# Altium schematic sheet StanzaBoard.SchDoc
size 594 x 420 mm
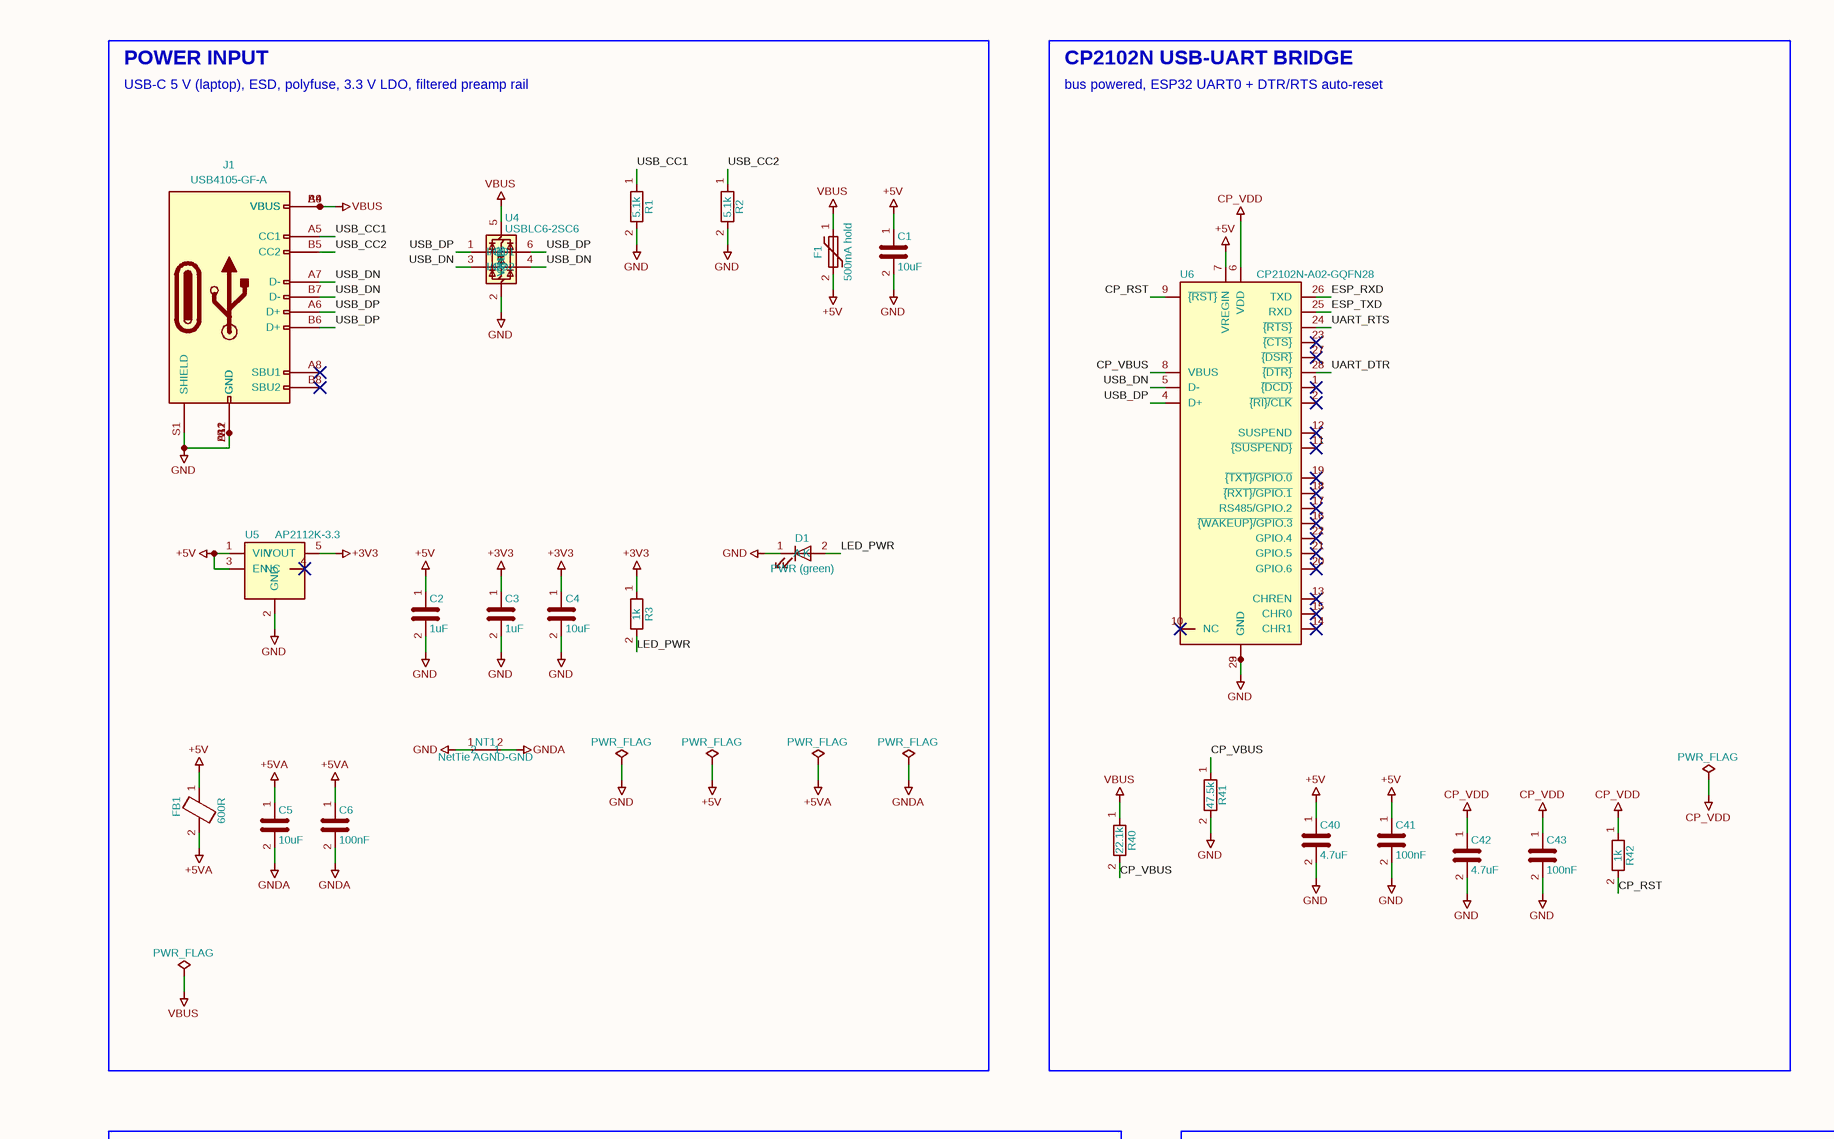
[diagram p0: StanzaBoard.SchDoc, top left]
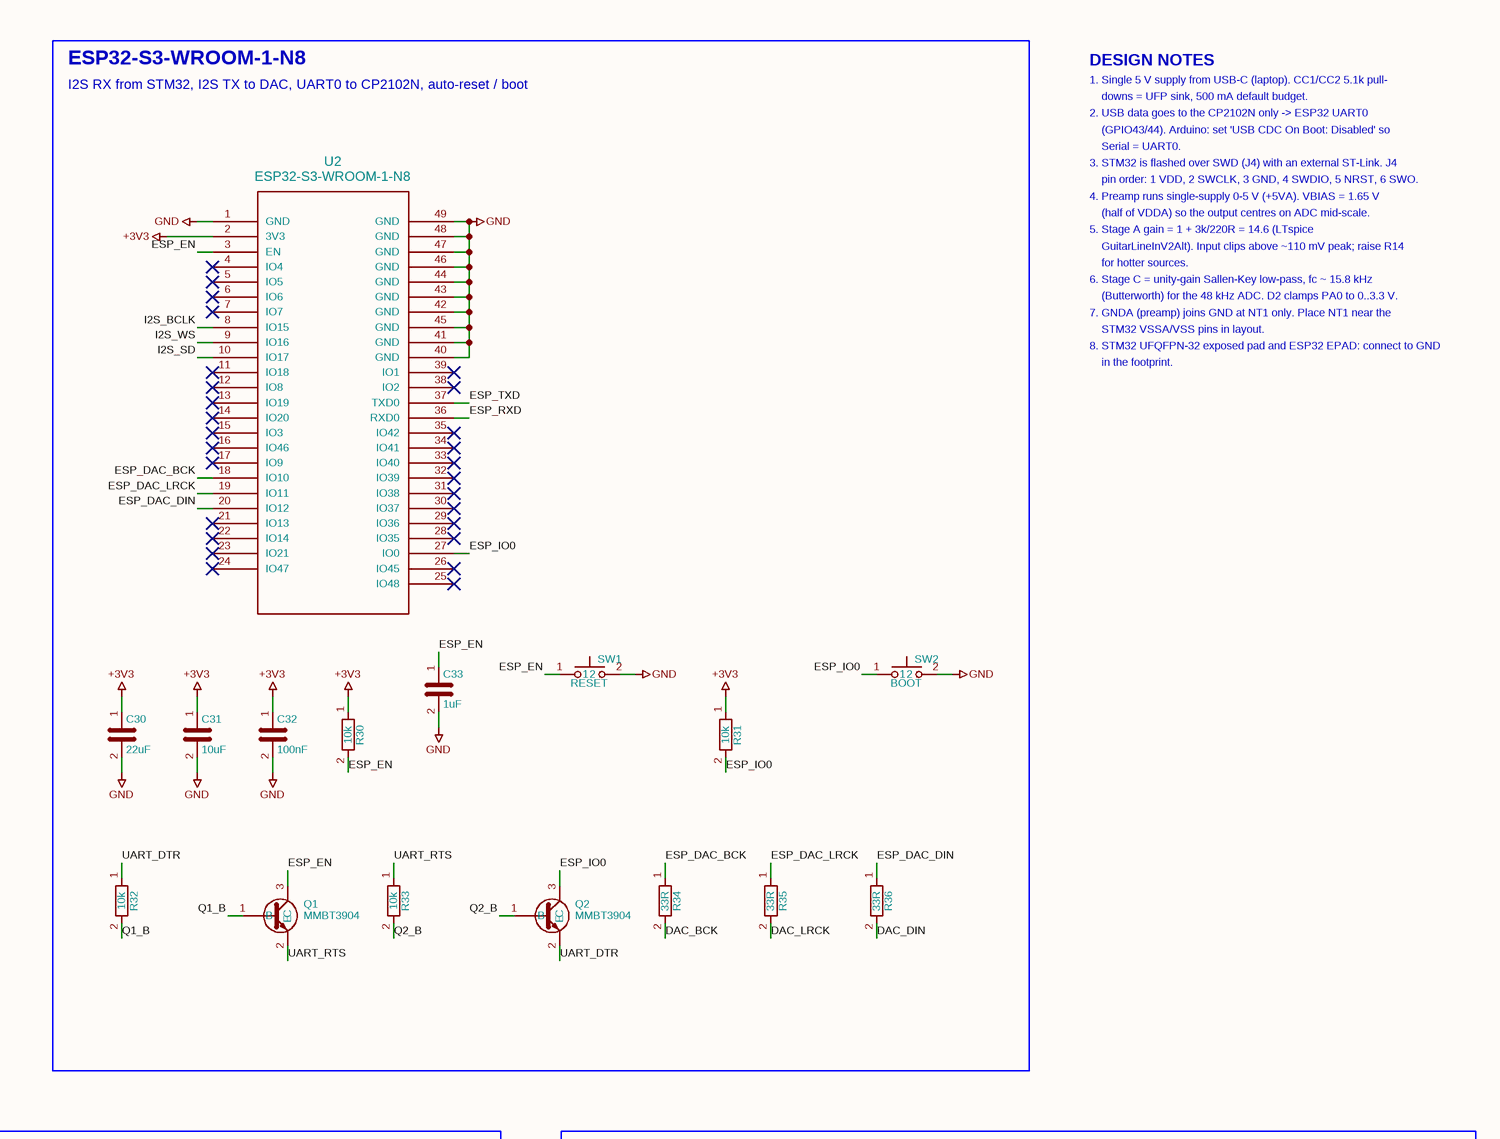
[diagram p1: StanzaBoard.SchDoc, top right]
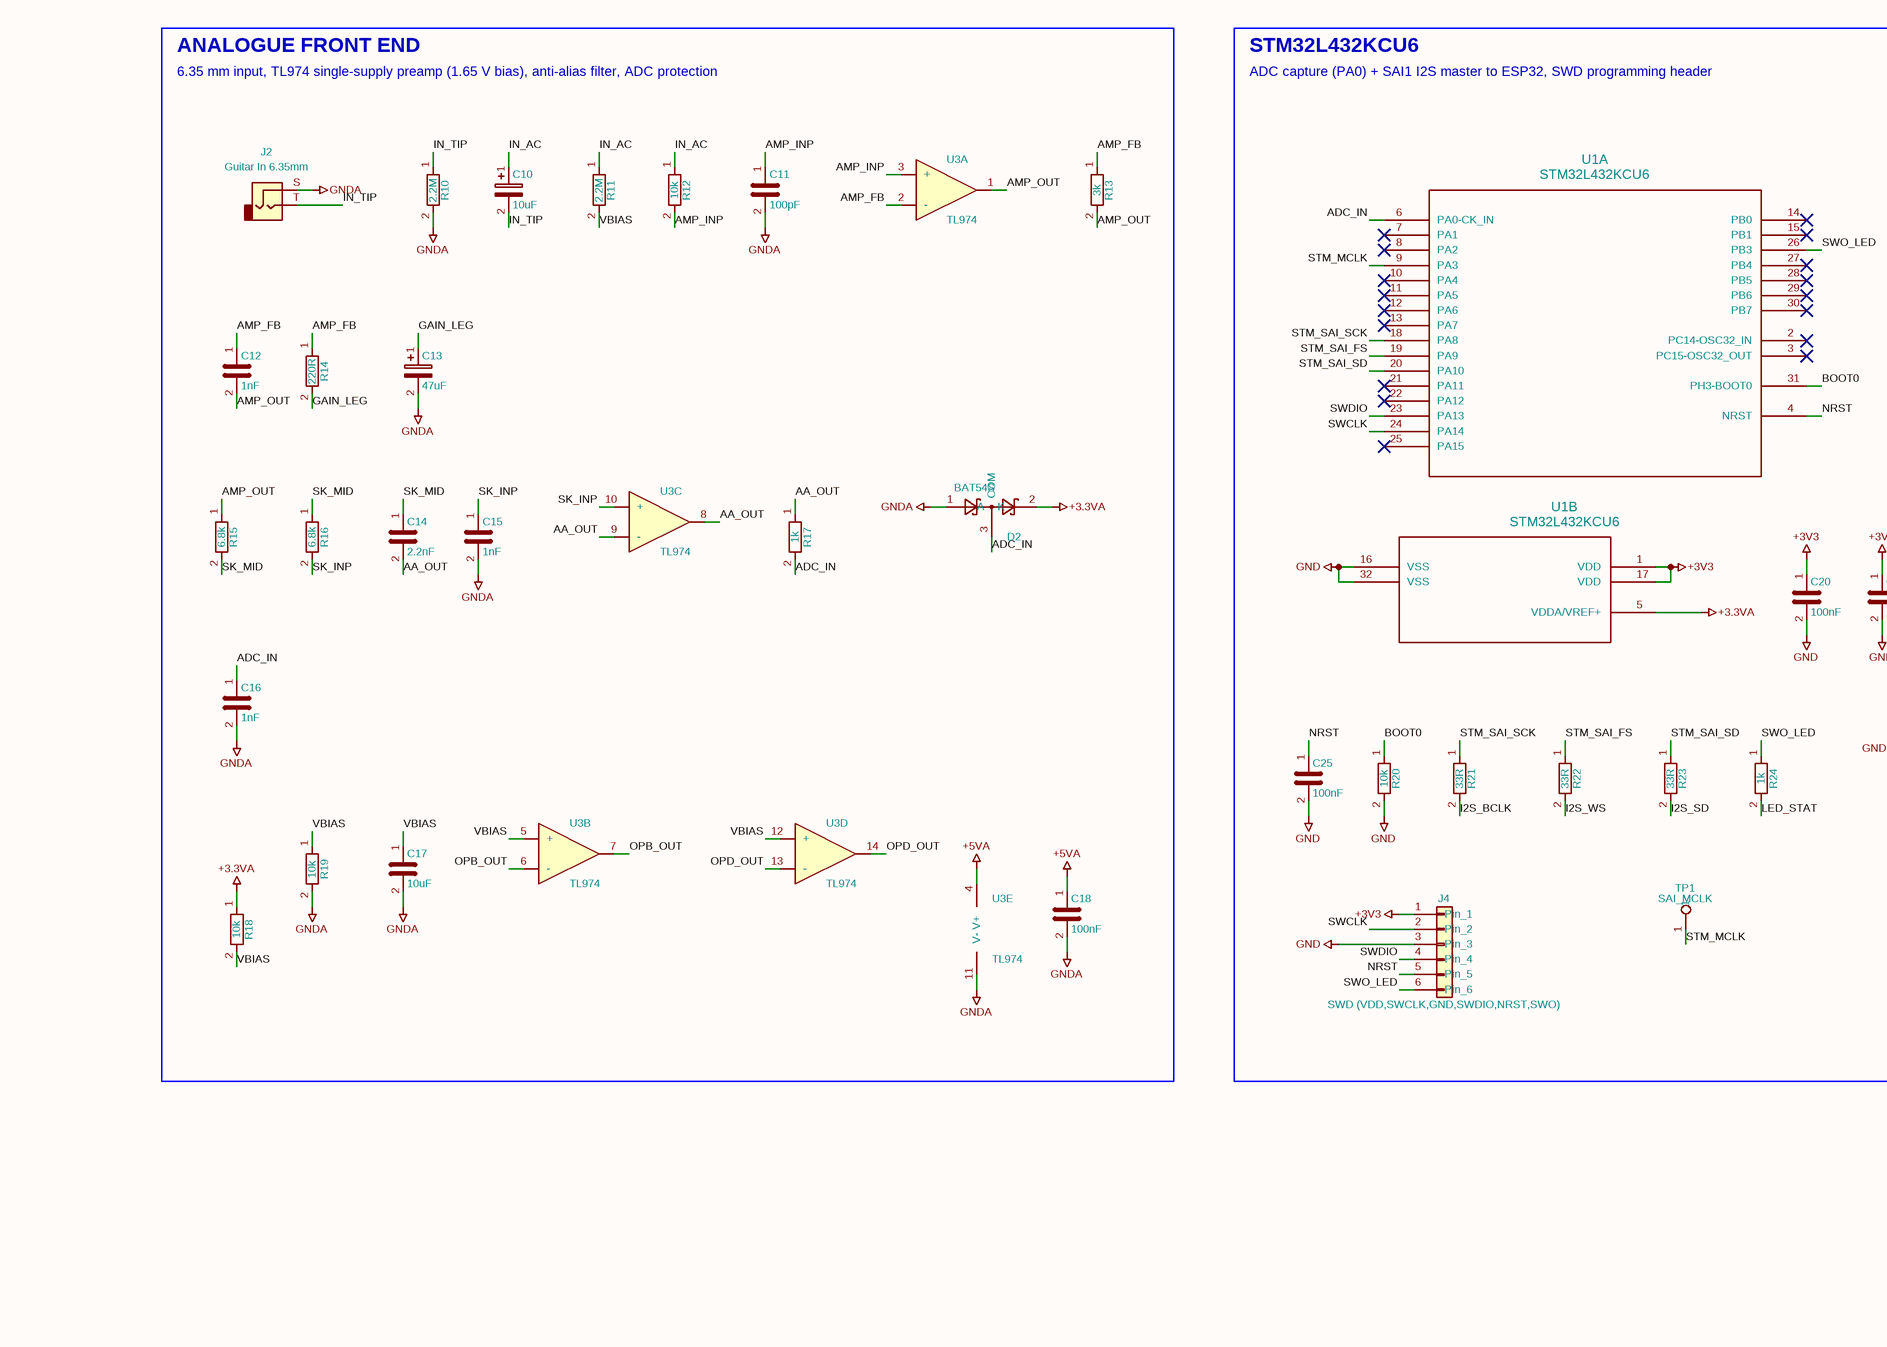
[diagram p2: StanzaBoard.SchDoc, bottom left]
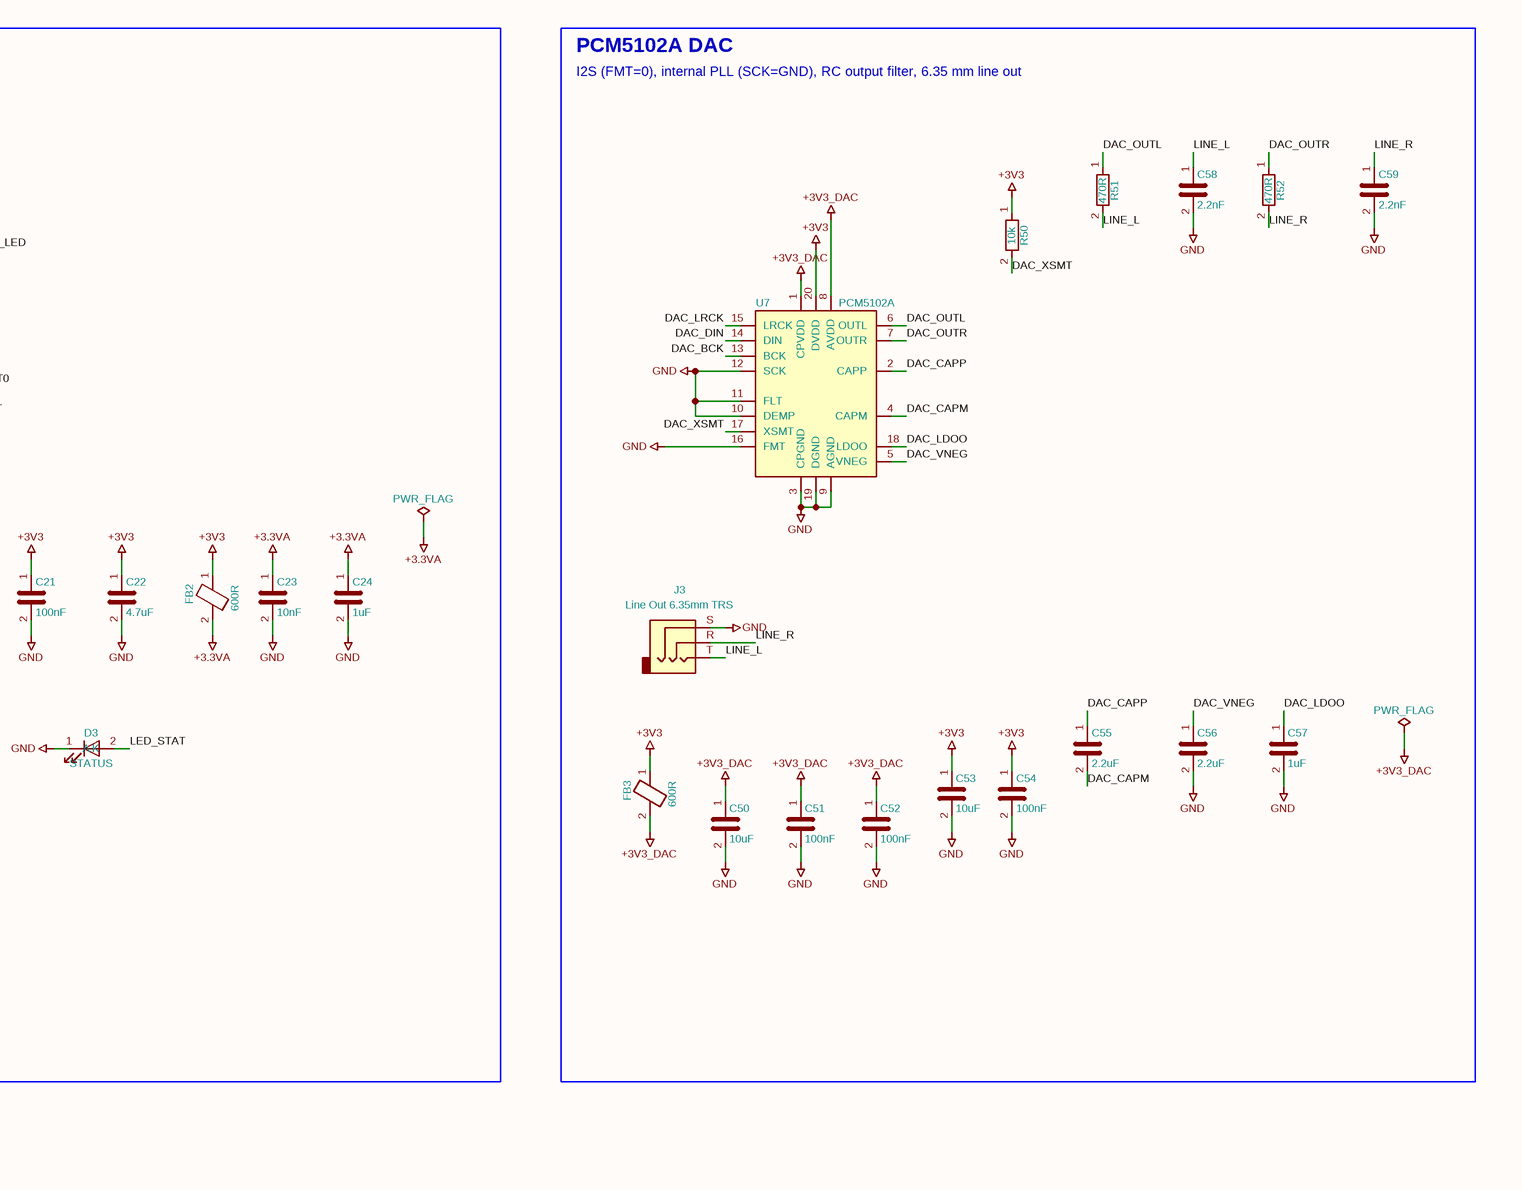
[diagram p3: StanzaBoard.SchDoc, bottom right]

## Parts
#FLG01  PWR_FLAG  (graphical)
#FLG02  PWR_FLAG  (graphical)
#FLG03  PWR_FLAG  (graphical)
#FLG04  PWR_FLAG  (graphical)
#FLG05  PWR_FLAG  (graphical)
#FLG06  PWR_FLAG  (graphical)
#FLG07  PWR_FLAG  (graphical)
#FLG08  PWR_FLAG  (graphical)
C1  10uF  [C_0805_2012Metric]
C2  1uF  [C_0603_1608Metric]
C3  1uF  [C_0603_1608Metric]
C4  10uF  [C_0805_2012Metric]
C5  10uF  [C_0805_2012Metric]
C6  100nF  [C_0603_1608Metric]
C10  10uF  [CP_Elec_5x5.4]
C11  100pF  [C_0603_1608Metric]
C12  1nF  [C_0603_1608Metric]
C13  47uF  [CP_Elec_5x5.4]
C14  2.2nF  [C_0603_1608Metric]
C15  1nF  [C_0603_1608Metric]
C16  1nF  [C_0603_1608Metric]
C17  10uF  [C_0805_2012Metric]
C18  100nF  [C_0603_1608Metric]
C20  100nF  [C_0603_1608Metric]
C21  100nF  [C_0603_1608Metric]
C22  4.7uF  [C_0805_2012Metric]
C23  10nF  [C_0603_1608Metric]
C24  1uF  [C_0603_1608Metric]
C25  100nF  [C_0603_1608Metric]
C30  22uF  [C_0805_2012Metric]
C31  10uF  [C_0805_2012Metric]
C32  100nF  [C_0603_1608Metric]
C33  1uF  [C_0603_1608Metric]
C40  4.7uF  [C_0805_2012Metric]
C41  100nF  [C_0603_1608Metric]
C42  4.7uF  [C_0805_2012Metric]
C43  100nF  [C_0603_1608Metric]
C50  10uF  [C_0805_2012Metric]
C51  100nF  [C_0603_1608Metric]
C52  100nF  [C_0603_1608Metric]
C53  10uF  [C_0805_2012Metric]
C54  100nF  [C_0603_1608Metric]
C55  2.2uF  [C_0603_1608Metric]
C56  2.2uF  [C_0603_1608Metric]
C57  1uF  [C_0603_1608Metric]
C58  2.2nF  [C_0603_1608Metric]
C59  2.2nF  [C_0603_1608Metric]
D1  PWR (green)  [LED_0603_1608Metric]
D2  BAT54S  [SOT-23]
D3  STATUS  [LED_0603_1608Metric]
F1  500mA hold  [Fuse_1206_3216Metric]
FB1  600R  [L_0603_1608Metric]
FB2  600R  [L_0603_1608Metric]
FB3  600R  [L_0603_1608Metric]
J1  USB4105-GF-A  [USB_C_Receptacle_GCT_USB4105-xx-A_16P_TopMnt_Horizontal]
J2  Guitar In 6.35mm  [Jack_6.35mm_Neutrik_NMJ4HCD2_Horizontal]
J3  Line Out 6.35mm TRS  [Jack_6.35mm_Neutrik_NMJ6HCD2_Horizontal]
J4  SWD (VDD,SWCLK,GND,SWDIO,NRST,SWO)  [PinHeader_1x06_P2.54mm_Vertical]
NT1  NetTie AGND-GND  [NetTie-2_SMD_Pad0.5mm]
Q1  MMBT3904  [SOT-23]
Q2  MMBT3904  [SOT-23]
R1  5.1k  [R_0603_1608Metric]
R2  5.1k  [R_0603_1608Metric]
R3  1k  [R_0603_1608Metric]
R10  2.2M  [R_0603_1608Metric]
R11  2.2M  [R_0603_1608Metric]
R12  10k  [R_0603_1608Metric]
R13  3k  [R_0603_1608Metric]
R14  220R  [R_0603_1608Metric]
R15  6.8k  [R_0603_1608Metric]
R16  6.8k  [R_0603_1608Metric]
R17  1k  [R_0603_1608Metric]
R18  10k  [R_0603_1608Metric]
R19  10k  [R_0603_1608Metric]
R20  10k  [R_0603_1608Metric]
R21  33R  [R_0603_1608Metric]
R22  33R  [R_0603_1608Metric]
R23  33R  [R_0603_1608Metric]
R24  1k  [R_0603_1608Metric]
R30  10k  [R_0603_1608Metric]
R31  10k  [R_0603_1608Metric]
R32  10k  [R_0603_1608Metric]
R33  10k  [R_0603_1608Metric]
R34  33R  [R_0603_1608Metric]
R35  33R  [R_0603_1608Metric]
R36  33R  [R_0603_1608Metric]
R40  22.1k  [R_0603_1608Metric]
R41  47.5k  [R_0603_1608Metric]
R42  1k  [R_0603_1608Metric]
R50  10k  [R_0603_1608Metric]
R51  470R  [R_0603_1608Metric]
R52  470R  [R_0603_1608Metric]
SW1  RESET  [SW_SPST_TL3342]
SW2  BOOT  [SW_SPST_TL3342]
TP1  SAI_MCLK  [TestPoint_Pad_D1.0mm]
U1  STM32L432KCU6  [UFQFPN-32]  (parts A,B of 2)
U2  ESP32-S3-WROOM-1-N8  [ESP32-S3-WROOM-1_EXP]
U3  TL974  [SOIC-14_3.9x8.7mm_P1.27mm]  (parts A,B,C,D,E of 5)
U4  USBLC6-2SC6  [SOT-23-6]
U5  AP2112K-3.3  [SOT-23-5]
U6  CP2102N-A02-GQFN28  [QFN-28-1EP_5x5mm_P0.5mm_EP3.35x3.35mm]
U7  PCM5102A  [TSSOP-20_4.4x6.5mm_P0.65mm]

## Blocks framed on the sheet
POWER INPUT: #FLG01 #FLG02 #FLG03 #FLG04 #FLG05 C1-C6 D1 F1 FB1 J1 NT1 R1-R3 U4 U5
CP2102N USB-UART BRIDGE: #FLG07 C40-C43 R40-R42 U6
ESP32-S3-WROOM-1-N8: C30-C33 Q1 Q2 R30-R36 SW1 SW2 U2
ANALOGUE FRONT END: C10-C18 D2 J2 R10-R19 U3
STM32L432KCU6: #FLG06 C20-C25 D3 FB2 J4 R20-R24 TP1 U1
PCM5102A DAC: #FLG08 C50-C59 FB3 J3 R50-R52 U7

## Nets
+3.3VA: #FLG06.1 C23.1 C24.1 D2.2(K) FB2.2 R18.1 U1.5(VDDA/VREF+)
+3V3: C3.1 C4.1 C20.1 C21.1 C22.1 C30.1 C31.1 C32.1 C53.1 C54.1 FB2.1 FB3.1 J4.1(Pin_1) R3.1 R30.1 R31.1 R50.1 U1.1(VDD) U1.17(VDD) U2.2(3V3) U5.5(VOUT) U7.20(DVDD)
+3V3_DAC: #FLG08.1 C50.1 C51.1 C52.1 FB3.2 U7.1(CPVDD) U7.8(AVDD)
+5V: #FLG02.1 C1.1 C2.1 C40.1 C41.1 F1.2 FB1.1 U5.1(VIN) U5.3(EN) U6.7(VREGIN)
+5VA: #FLG03.1 C5.1 C6.1 C18.1 FB1.2 U3.4(V+)
CP_VDD: #FLG07.1 C42.1 C43.1 R42.1 U6.6(VDD)
GND: #FLG01.1 C1.2 C2.2 C3.2 C4.2 C20.2 C21.2 C22.2 C23.2 C24.2 C25.2 C30.2 C31.2 C32.2 C33.2 C40.2 C41.2 C42.2 C43.2 C50.2 C51.2 C52.2 C53.2 C54.2 C56.2 C57.2 C58.2 C59.2 D1.1(K) D3.1(K) J1.A1(GND) J1.A12(GND) J1.B1(GND) J1.B12(GND) J1.S1(SHIELD) J3.S J4.3(Pin_3) NT1.1 R1.2 R2.2 R20.2 R41.2 SW1.2 SW2.2 U1.16(VSS) U1.32(VSS) U2.1(GND) U2.40(GND) U2.41(GND) U2.42(GND) U2.43(GND) U2.44(GND) U2.45(GND) U2.46(GND) U2.47(GND) U2.48(GND) U2.49(GND) U4.2(GND) U5.2(GND) U6.3(GND) U6.29(GND) U7.3(CPGND) U7.9(AGND) U7.10(DEMP) U7.11(FLT) U7.12(SCK) U7.16(FMT) U7.19(DGND)
GNDA: #FLG04.1 C5.2 C6.2 C11.2 C13.2 C15.2 C16.2 C17.2 C18.2 D2.1(A) J2.S NT1.2 R10.2 R19.2 U3.11(V-)
VBUS: #FLG05.1 F1.1 J1.A4(VBUS) J1.A9(VBUS) J1.B4(VBUS) J1.B9(VBUS) R40.1 U4.5(VBUS)
AA_OUT: C14.2 R17.1 U3.8 U3.9(-)
ADC_IN: C16.1 D2.3(COM) R17.2 U1.6(PA0-CK_IN)
AMP_FB: C12.1 R13.1 R14.1 U3.2(-)
AMP_INP: C11.1 R12.2 U3.3(+)
AMP_OUT: C12.2 R13.2 R15.1 U3.1
BOOT0: R20.1 U1.31(PH3-BOOT0)
CP_RST: R42.2 U6.9(~{{RST}})
CP_VBUS: R40.2 R41.1 U6.8(VBUS)
DAC_BCK: R34.2 U7.13(BCK)
DAC_CAPM: C55.2 U7.4(CAPM)
DAC_CAPP: C55.1 U7.2(CAPP)
DAC_DIN: R36.2 U7.14(DIN)
DAC_LDOO: C57.1 U7.18(LDOO)
DAC_LRCK: R35.2 U7.15(LRCK)
DAC_OUTL: R51.1 U7.6(OUTL)
DAC_OUTR: R52.1 U7.7(OUTR)
DAC_VNEG: C56.1 U7.5(VNEG)
DAC_XSMT: R50.2 U7.17(XSMT)
ESP_DAC_BCK: R34.1 U2.18(IO10)
ESP_DAC_DIN: R36.1 U2.20(IO12)
ESP_DAC_LRCK: R35.1 U2.19(IO11)
ESP_EN: C33.1 Q1.3(C) R30.2 SW1.1 U2.3(EN)
ESP_IO0: Q2.3(C) R31.2 SW2.1 U2.27(IO0)
ESP_RXD: U2.36(RXD0) U6.26(TXD)
ESP_TXD: U2.37(TXD0) U6.25(RXD)
GAIN_LEG: C13.1 R14.2
I2S_BCLK: R21.2 U2.8(IO15)
I2S_SD: R23.2 U2.10(IO17)
I2S_WS: R22.2 U2.9(IO16)
IN_AC: C10.1 R11.1 R12.1
IN_TIP: C10.2 J2.T R10.1
LED_PWR: D1.2(A) R3.2
LED_STAT: D3.2(A) R24.2
LINE_L: C58.1 J3.T R51.2
LINE_R: C59.1 J3.R R52.2
NRST: C25.1 J4.5(Pin_5) U1.4(NRST)
OPB_OUT: U3.6(-) U3.7
OPD_OUT: U3.13(-) U3.14
Q1_B: Q1.1(B) R32.2
Q2_B: Q2.1(B) R33.2
SK_INP: C15.1 R16.2 U3.10(+)
SK_MID: C14.1 R15.2 R16.1
STM_MCLK: TP1.1 U1.9(PA3)
STM_SAI_FS: R22.1 U1.19(PA9)
STM_SAI_SCK: R21.1 U1.18(PA8)
STM_SAI_SD: R23.1 U1.20(PA10)
SWCLK: J4.2(Pin_2) U1.24(PA14)
SWDIO: J4.4(Pin_4) U1.23(PA13)
SWO_LED: J4.6(Pin_6) R24.1 U1.26(PB3)
UART_DTR: Q2.2(E) R32.1 U6.28(~{{DTR}})
UART_RTS: Q1.2(E) R33.1 U6.24(~{{RTS}})
USB_CC1: J1.A5(CC1) R1.1
USB_CC2: J1.B5(CC2) R2.1
USB_DN: J1.A7(D-) J1.B7(D-) U4.3(I/O2) U4.4(I/O2) U6.5(D-)
USB_DP: J1.A6(D+) J1.B6(D+) U4.1(I/O1) U4.6(I/O1) U6.4(D+)
VBIAS: C17.1 R11.2 R18.2 R19.1 U3.5(+) U3.12(+)

Not connected (* = marked no-connect by the designer): J1 A8(SBU1)* B8(SBU2)*; U1 2(PC14-OSC32_IN)* 3(PC15-OSC32_OUT)* 7(PA1)* 8(PA2)* 10(PA4)* 11(PA5)* 12(PA6)* 13(PA7)* 14(PB0)* 15(PB1)* 21(PA11)* 22(PA12)* 25(PA15)* 27(PB4)* 28(PB5)* 29(PB6)* 30(PB7)*; U2 4(IO4)* 5(IO5)* 6(IO6)* 7(IO7)* 11(IO18)* 12(IO8)* 13(IO19)* 14(IO20)* 15(IO3)* 16(IO46)* 17(IO9)* 21(IO13)* 22(IO14)* 23(IO21)* 24(IO47)* 25(IO48)* 26(IO45)* 28(IO35)* 29(IO36)* 30(IO37)* 31(IO38)* 32(IO39)* 33(IO40)* 34(IO41)* 35(IO42)* 38(IO2)* 39(IO1)*; U5 4(NC)*; U6 1(~{{DCD}})* 2(~{{RI}/CLK})* 10(NC)* 11(~{{SUSPEND}})* 12(SUSPEND)* 13(CHREN)* 14(CHR1)* 15(CHR0)* 16(~{{WAKEUP}/GPIO.3})* 17(RS485/GPIO.2)* 18(~{{RXT}/GPIO.1})* 19(~{{TXT}/GPIO.0})* 20(GPIO.6)* 21(GPIO.5)* 22(GPIO.4)* 23(~{{CTS}})* 27(~{{DSR}})*

## Notes on the sheet
- USB-C 5 V (laptop), ESD, polyfuse, 3.3 V LDO, filtered preamp rail
- bus powered, ESP32 UART0 + DTR/RTS auto-reset
- I2S RX from STM32, I2S TX to DAC, UART0 to CP2102N, auto-reset / boot
- DESIGN NOTES
- 1. Single 5 V supply from USB-C (laptop). CC1/CC2 5.1k pull-
- downs = UFP sink, 500 mA default budget.
- 2. USB data goes to the CP2102N only -> ESP32 UART0
- (GPIO43/44). Arduino: set 'USB CDC On Boot: Disabled' so
- Serial = UART0.
- 3. STM32 is flashed over SWD (J4) with an external ST-Link. J4
- pin order: 1 VDD, 2 SWCLK, 3 GND, 4 SWDIO, 5 NRST, 6 SWO.
- 4. Preamp runs single-supply 0-5 V (+5VA). VBIAS = 1.65 V
- (half of VDDA) so the output centres on ADC mid-scale.
- 5. Stage A gain = 1 + 3k/220R = 14.6 (LTspice
- GuitarLineInV2Alt). Input clips above ~110 mV peak; raise R14
- for hotter sources.
- 6. Stage C = unity-gain Sallen-Key low-pass, fc ~ 15.8 kHz
- (Butterworth) for the 48 kHz ADC. D2 clamps PA0 to 0..3.3 V.
- 7. GNDA (preamp) joins GND at NT1 only. Place NT1 near the
- STM32 VSSA/VSS pins in layout.
- 8. STM32 UFQFPN-32 exposed pad and ESP32 EPAD: connect to GND
- in the footprint.
- 6.35 mm input, TL974 single-supply preamp (1.65 V bias), anti-alias filter, ADC protection
- ADC capture (PA0) + SAI1 I2S master to ESP32, SWD programming header
- I2S (FMT=0), internal PLL (SCK=GND), RC output filter, 6.35 mm line out
- 1
- 2
- 3
- 4
- 5
- 6
- 7
- 8
- 9
- 10
- 11
- A
- B
- C
- D
- E
- F
- G
- H
- Single 5 V USB-C supply. Generated schematic - review before layout.
- Title: Stanza Board - Guitar In / STM32 / ESP32-S3 / PCM5102A
- File: StanzaBoard.kicad_sch
- Sheet: /
- Sonido
- KiCad E.D.A.  kicad (5.1.4)-1
- Size: A2
- Date: 2026-09-29
- Rev: A
- Id: 1/1

## Library data of the parts
#FLG01 #FLG02 #FLG03 #FLG04 #FLG05 #FLG06 #FLG07 #FLG08 = PWR_FLAG: Description: Special symbol for telling ERC where power comes from; Value: PWR_FLAG
C1-C6 C11 C12 C14-C18 C20-C25 C30-C33 C40-C43 C50-C59 = C: Description: Unpolarized capacitor
  C1 C4 C5 C17 C31 C50 C53: Value: 10uF; Footprint: Capacitor_SMD:C_0805_2012Metric
  C2 C3 C24 C33 C57: Value: 1uF; Footprint: Capacitor_SMD:C_0603_1608Metric
  C6 C18 C20 C21 C25 C32 C41 C43 C51 C52 C54: Value: 100nF; Footprint: Capacitor_SMD:C_0603_1608Metric
  C11: Value: 100pF; Footprint: Capacitor_SMD:C_0603_1608Metric
  C12 C15 C16: Value: 1nF; Footprint: Capacitor_SMD:C_0603_1608Metric
  C14 C58 C59: Value: 2.2nF; Footprint: Capacitor_SMD:C_0603_1608Metric
  C22 C40 C42: Value: 4.7uF; Footprint: Capacitor_SMD:C_0805_2012Metric
  C23: Value: 10nF; Footprint: Capacitor_SMD:C_0603_1608Metric
  C30: Value: 22uF; Footprint: Capacitor_SMD:C_0805_2012Metric
  C55 C56: Value: 2.2uF; Footprint: Capacitor_SMD:C_0603_1608Metric
C10 C13 = C_Polarized: Description: Polarized capacitor; Footprint: Capacitor_SMD:CP_Elec_5x5.4
  C10: Value: 10uF
  C13: Value: 47uF
D1 D3 = LED: Description: Light emitting diode; Sim.Pins: 1=K 2=A; Footprint: LED_SMD:LED_0603_1608Metric
  D1: Value: PWR (green)
  D3: Value: STATUS
D2 = BAT54S: Description: Vr 30V, If 200mA, Dual schottky barrier diode, in series, SOT-323; Value: BAT54S; Footprint: Package_TO_SOT_SMD:SOT-23
F1 = Polyfuse: Description: Resettable fuse, polymeric positive temperature coefficient; Value: 500mA hold; Footprint: Fuse:Fuse_1206_3216Metric
FB1-FB3 = FerriteBead: Description: Ferrite bead; Value: 600R; Footprint: Inductor_SMD:L_0603_1608Metric
J1 = USB_C_Receptacle_USB2.0_16P: Description: USB 2.0-only 16P Type-C Receptacle connector; Value: USB4105-GF-A; Footprint: Connector_USB:USB_C_Receptacle_GCT_USB4105-xx-A_16P_TopMnt_Horizontal
J2 = AudioJack2: Description: Audio Jack, 2 Poles (Mono / TS); Value: Guitar In 6.35mm; Footprint: Connector_Audio:Jack_6.35mm_Neutrik_NMJ4HCD2_Horizontal
J3 = AudioJack3: Description: Audio Jack, 3 Poles (Stereo / TRS); Value: Line Out 6.35mm TRS; Footprint: Connector_Audio:Jack_6.35mm_Neutrik_NMJ6HCD2_Horizontal
J4 = Conn_01x06: Description: Generic connector, single row, 01x06, script generated (kicad-library-utils/schlib/autogen/connector/); Value: SWD (VDD,SWCLK,GND,SWDIO,NRST,SWO); Footprint: Connector_PinHeader_2.54mm:PinHeader_1x06_P2.54mm_Vertical
NT1 = NetTie_2: Description: Net tie, 2 pins; Value: NetTie AGND-GND; Footprint: NetTie:NetTie-2_SMD_Pad0.5mm
Q1 Q2 = MMBT3904: Description: 0.2A Ic, 40V Vce, Small Signal NPN Transistor, SOT-23; Sim.Device: NPN; Sim.Pins: 1=B 2=E 3=C; Value: MMBT3904; Footprint: Package_TO_SOT_SMD:SOT-23
R1-R3 R10-R24 R30-R36 R40-R42 R50-R52 = R: Description: Resistor; Footprint: Resistor_SMD:R_0603_1608Metric
  R1 R2: Value: 5.1k
  R3 R17 R24 R42: Value: 1k
  R10 R11: Value: 2.2M
  R12 R18-R20 R30-R33 R50: Value: 10k
  R13: Value: 3k
  R14: Value: 220R
  R15 R16: Value: 6.8k
  R21-R23 R34-R36: Value: 33R
  R40: Value: 22.1k
  R41: Value: 47.5k
  R51 R52: Value: 470R
SW1 SW2 = SW_Push: Description: Push button switch, generic, two pins; Footprint: Button_Switch_SMD:SW_SPST_TL3342
  SW1: Value: RESET
  SW2: Value: BOOT
TP1 = TestPoint: Description: test point; Value: SAI_MCLK; Footprint: TestPoint:TestPoint_Pad_D1.0mm
U3 = TL074: Description: Quad Low-Noise JFET-Input Operational Amplifiers, DIP-14/SOIC-14; Value: TL974; Footprint: Package_SO:SOIC-14_3.9x8.7mm_P1.27mm
U4 = USBLC6-2SC6: Description: Very low capacitance ESD protection diode, 2 data-line, SOT-23-6; Value: USBLC6-2SC6; Footprint: Package_TO_SOT_SMD:SOT-23-6
U5 = AP2112K-3.3: Description: 600mA low dropout linear regulator, with enable pin, 3.8V-6V input voltage range, 3.3V fixed positive output, SOT-23-5; Value: AP2112K-3.3; Footprint: Package_TO_SOT_SMD:SOT-23-5
U6 = CP2102N-Axx-xQFN28: Description: USB to UART master bridge, QFN-28; Value: CP2102N-A02-GQFN28; Footprint: Package_DFN_QFN:QFN-28-1EP_5x5mm_P0.5mm_EP3.35x3.35mm
U7 = PCM5102A: Description: 2.1 VRMS, 112dB Audio Stereo DAC with PLL and 32-bit, 384kHz PCM Interface, TSSOP-20; Value: PCM5102A; Footprint: Package_SO:TSSOP-20_4.4x6.5mm_P0.65mm
U1 = STM32L432KCU6: Value: STM32L432KCU6
U2 = ESP32-S3-WROOM-1-N8: Value: ESP32-S3-WROOM-1-N8